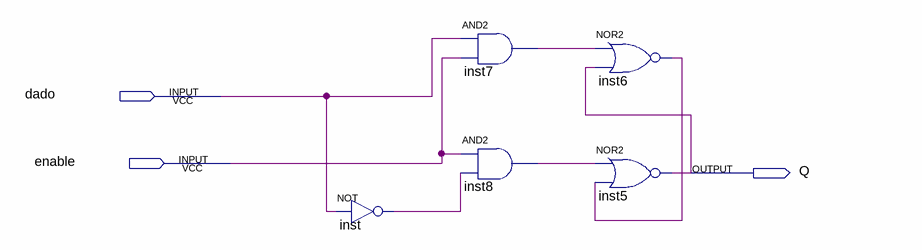
[diagram p0: schematic sheet]
// Quartus schematic registrador_flip-flop_d_enable.bdf as structural Verilog: 5 symbols, 3 pins
module \registrador_flip-flop_d_enable  (
  input  dado,
  input  enable,
  output Q
);

  wire inst6_out, inst7_out, inst8_out, inst_out;

  not inst (inst_out, dado);
  and inst7 (inst7_out, dado, enable);
  and inst8 (inst8_out, enable, inst_out);
  nor inst6 (inst6_out, inst7_out, Q);
  nor inst5 (Q, inst8_out, inst6_out);
endmodule
